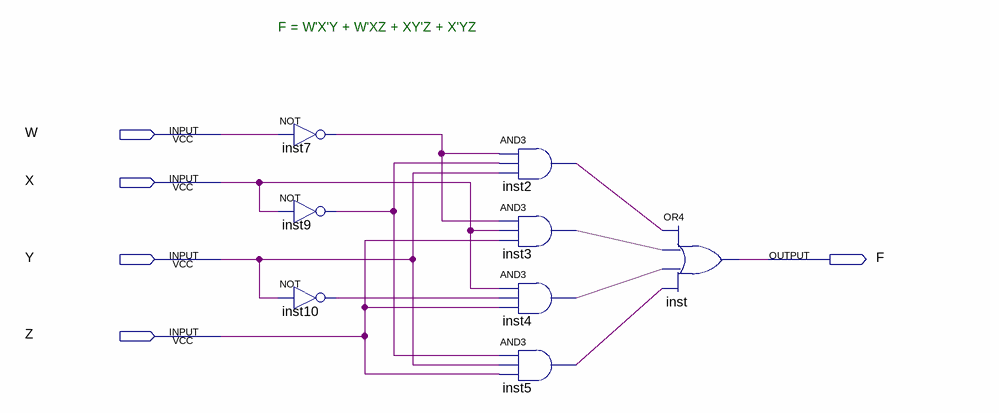
[diagram p0: schematic sheet]
// Quartus schematic Question1.bdf as structural Verilog: 8 symbols, 5 pins
module Question1 (
  input  W,
  input  X,
  input  Y,
  input  Z,
  output F
);

  wire inst2_out, inst3_out, inst4_out, inst5_out, inst7_out, inst9_out, inst10_out;

  not inst7 (inst7_out, W);
  not inst9 (inst9_out, X);
  not inst10 (inst10_out, Y);
  and inst2 (inst2_out, inst7_out, inst9_out, Y);
  and inst3 (inst3_out, inst7_out, X, Z);
  and inst4 (inst4_out, X, inst10_out, Z);
  and inst5 (inst5_out, inst9_out, Y, Z);
  or inst (F, inst2_out, inst3_out, inst4_out, inst5_out);

  // Notes on the sheet:
  //   F = W'X'Y + W'XZ + XY'Z + X'YZ           
endmodule
